# Altium schematic sheet symbol_graphics.SchDoc
size 254 x 203 mm
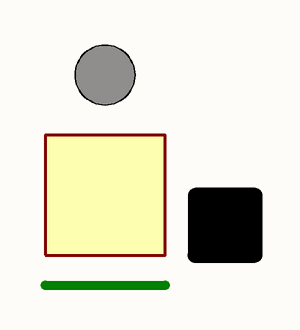
[diagram p0: symbol_graphics.SchDoc]

## Parts
?  (no value)

## Library data of the parts
? = Box